# Altium schematic sheet 05_FPGA_Interface.SchDoc
size A3; SheetNumber: 6; SheetTotal: 6
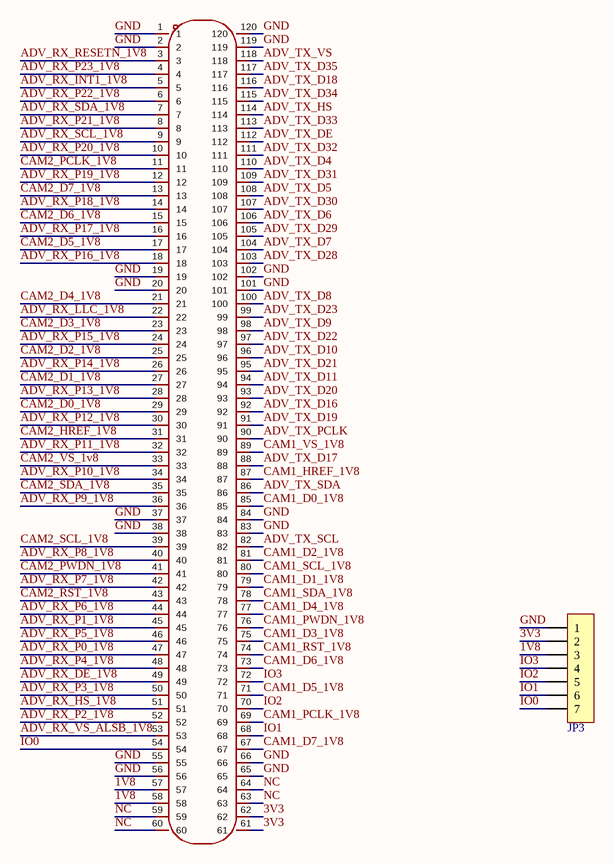
[diagram p0: 05_FPGA_Interface.SchDoc]

## Parts
CN1  xdb612-120p-cor  [CONN-SMD_120P-P0.80_THD0812F-120BV-GF]  (value not drawn)
JP3  HDR-1X7  [HDR2.54-LI-7P]  (value not drawn)

## Nets
1V8: CN1.57 CN1.58 JP3.3
3V3: CN1.61 CN1.62 JP3.2
ADV_RX_DE_1V8: CN1.49
ADV_RX_HS_1V8: CN1.51
ADV_RX_INT1_1V8: CN1.5
ADV_RX_LLC_1V8: CN1.22
ADV_RX_P0_1V8: CN1.47
ADV_RX_P1_1V8: CN1.45
ADV_RX_P2_1V8: CN1.52
ADV_RX_P3_1V8: CN1.50
ADV_RX_P4_1V8: CN1.48
ADV_RX_P5_1V8: CN1.46
ADV_RX_P6_1V8: CN1.44
ADV_RX_P7_1V8: CN1.42
ADV_RX_P8_1V8: CN1.40
ADV_RX_P9_1V8: CN1.36
ADV_RX_P10_1V8: CN1.34
ADV_RX_P11_1V8: CN1.32
ADV_RX_P12_1V8: CN1.30
ADV_RX_P13_1V8: CN1.28
ADV_RX_P14_1V8: CN1.26
ADV_RX_P15_1V8: CN1.24
ADV_RX_P16_1V8: CN1.18
ADV_RX_P17_1V8: CN1.16
ADV_RX_P18_1V8: CN1.14
ADV_RX_P19_1V8: CN1.12
ADV_RX_P20_1V8: CN1.10
ADV_RX_P21_1V8: CN1.8
ADV_RX_P22_1V8: CN1.6
ADV_RX_P23_1V8: CN1.4
ADV_RX_RESETN_1V8: CN1.3
ADV_RX_SCL_1V8: CN1.9
ADV_RX_SDA_1V8: CN1.7
ADV_RX_VS_ALSB_1V8: CN1.53
ADV_TX_D4: CN1.110
ADV_TX_D5: CN1.108
ADV_TX_D6: CN1.106
ADV_TX_D7: CN1.104
ADV_TX_D8: CN1.100
ADV_TX_D9: CN1.98
ADV_TX_D10: CN1.96
ADV_TX_D11: CN1.94
ADV_TX_D16: CN1.92
ADV_TX_D17: CN1.88
ADV_TX_D18: CN1.116
ADV_TX_D19: CN1.91
ADV_TX_D20: CN1.93
ADV_TX_D21: CN1.95
ADV_TX_D22: CN1.97
ADV_TX_D23: CN1.99
ADV_TX_D28: CN1.103
ADV_TX_D29: CN1.105
ADV_TX_D30: CN1.107
ADV_TX_D31: CN1.109
ADV_TX_D32: CN1.111
ADV_TX_D33: CN1.113
ADV_TX_D34: CN1.115
ADV_TX_D35: CN1.117
ADV_TX_DE: CN1.112
ADV_TX_HS: CN1.114
ADV_TX_PCLK: CN1.90
ADV_TX_SCL: CN1.82
ADV_TX_SDA: CN1.86
ADV_TX_VS: CN1.118
CAM1_D0_1V8: CN1.85
CAM1_D1_1V8: CN1.79
CAM1_D2_1V8: CN1.81
CAM1_D3_1V8: CN1.75
CAM1_D4_1V8: CN1.77
CAM1_D5_1V8: CN1.71
CAM1_D6_1V8: CN1.73
CAM1_D7_1V8: CN1.67
CAM1_HREF_1V8: CN1.87
CAM1_PCLK_1V8: CN1.69
CAM1_PWDN_1V8: CN1.76
CAM1_RST_1V8: CN1.74
CAM1_SCL_1V8: CN1.80
CAM1_SDA_1V8: CN1.78
CAM1_VS_1V8: CN1.89
CAM2_D0_1V8: CN1.29
CAM2_D1_1V8: CN1.27
CAM2_D2_1V8: CN1.25
CAM2_D3_1V8: CN1.23
CAM2_D4_1V8: CN1.21
CAM2_D5_1V8: CN1.17
CAM2_D6_1V8: CN1.15
CAM2_D7_1V8: CN1.13
CAM2_HREF_1V8: CN1.31
CAM2_PCLK_1V8: CN1.11
CAM2_PWDN_1V8: CN1.41
CAM2_RST_1V8: CN1.43
CAM2_SCL_1V8: CN1.39
CAM2_SDA_1V8: CN1.35
CAM2_VS_1v8: CN1.33
GND: CN1.1 CN1.2 CN1.19 CN1.20 CN1.37 CN1.38 CN1.55 CN1.56 CN1.65 CN1.66 CN1.83 CN1.84 CN1.101 CN1.102 CN1.119 CN1.120 JP3.1
IO0: CN1.54 JP3.7
IO1: CN1.68 JP3.6
IO2: CN1.70 JP3.5
IO3: CN1.72 JP3.4
NC: CN1.59 CN1.60 CN1.63 CN1.64

## Library data of the parts
CN1 = xdb612-120p-cor: PIN总数:120P;间距:0.8mm;安装方式:立贴;排数:2;额定电流:500mA;工作温度:-45℃~+80℃;; Manufacturer: LX(连欣科技); AddInBom: yes; ModelId: 534587499f204ed784a0d3d633a8bbcf; ModelTransform: 2118.10616,236.22,0,0,0,0,0.002,0,-27.559; Pitch: 0.8mm; Current Rating: 500mA; Symbol: XDB612-120P-COR; LCSC Part Name: AMP宏致同款BTB板对板PH0.8-2*60P/120PIN母座 合高5.0MM; SupplierPart: C7527742; ManufacturerPart: XDB612-120P-COR; Supplier Footprint: SMD,P=0.8mm; JLCPCB Part Class: Extended Part; Datasheet: https://item.szlcsc.com/datasheet/XDB612-120P-COR/8623463.html; Supplier: LCSC; ConvertToPcb: yes; FootprintName: CONN-SMD_120P-P0.80_THD0812F-120BV-GF; ModelName: CONN-SMD_120P-P0.80_THD0812F-120BV-GF; Number of Pins: 120P; Mounting Type: 立贴; Number of Rows: 2; Contact Material: 铜; Contact Plating: 金; Operating Temperature: -45℃~+80℃
JP3 = Header 7: 7P接插件; 版权归属: 封装库来自淘宝 ID：黄晶宝石; BOM名称: 7P接插件; 学习资源: https://shop463601444.taobao.com